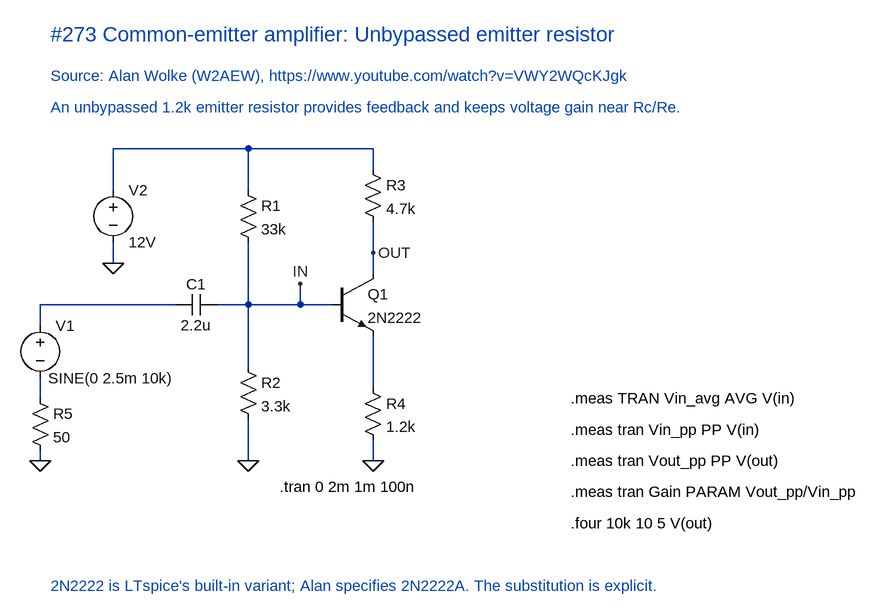
[diagram p0: schematic Unbypassed emitter resistor.asc]
Unbypassed emitter resistor.asc, the LTspice schematic file:
Version 4.1
SHEET 1 1188 680
WIRE 160 -128 -48 -128
WIRE 352 -128 160 -128
WIRE 352 -96 352 -128
WIRE -48 -64 -48 -128
WIRE 160 -64 160 -128
WIRE 352 32 352 -16
WIRE -48 48 -48 16
WIRE 352 64 352 32
WIRE 48 112 -160 112
WIRE 160 112 160 16
WIRE 160 112 112 112
WIRE 240 112 240 80
WIRE 240 112 160 112
WIRE 288 112 240 112
WIRE -160 144 -160 112
WIRE 160 208 160 112
WIRE 352 208 352 160
WIRE 352 240 352 208
WIRE -160 256 -160 224
WIRE -160 352 -160 336
WIRE 160 352 160 288
WIRE 352 352 352 320
FLAG 160 352 0
FLAG 352 352 0
FLAG -48 48 0
FLAG 352 32 OUT
FLAG -160 352 0
FLAG 240 80 IN
SYMBOL cap 112 96 R90
WINDOW 0 0 32 VBottom 2
WINDOW 3 32 32 VTop 2
SYMATTR InstName C1
SYMATTR Value 2.2u
SYMBOL res 144 -80 R0
SYMATTR InstName R1
SYMATTR Value 33k
SYMBOL res 144 192 R0
SYMATTR InstName R2
SYMATTR Value 3.3k
SYMBOL npn 288 64 R0
SYMATTR InstName Q1
SYMATTR Value 2N2222
SYMBOL res 336 -112 R0
SYMATTR InstName R3
SYMATTR Value 4.7k
SYMBOL res 336 224 R0
SYMATTR InstName R4
SYMATTR Value 1.2k
SYMBOL voltage -48 -80 R0
WINDOW 123 0 0 Left 0
WINDOW 39 0 0 Left 0
SYMATTR InstName V2
SYMATTR Value 12V
SYMBOL voltage -160 128 R0
WINDOW 3 12 97 Left 2
WINDOW 123 0 0 Left 0
WINDOW 39 0 0 Left 0
SYMATTR Value SINE(0 2.5m 10k)
SYMATTR InstName V1
SYMBOL res -176 240 R0
SYMATTR InstName R5
SYMATTR Value 50
TEXT 208 392 Left 2 !.tran 0 2m 1m 100n
TEXT 656 256 Left 2 !.meas TRAN Vin_avg AVG V(in)
TEXT 656 304 Left 2 !.meas tran Vin_pp PP V(in)
TEXT 656 352 Left 2 !.meas tran Vout_pp PP V(out)
TEXT 656 400 Left 2 !.meas tran Gain PARAM Vout_pp/Vin_pp
TEXT 656 448 Left 2 !.four 10k 10 5 V(out)
TEXT -144 -304 Left 3 ;#273 Common-emitter amplifier: Unbypassed emitter resistor
TEXT -144 -240 Left 2 ;Source: Alan Wolke (W2AEW), https://www.youtube.com/watch?v=VWY2WQcKJgk
TEXT -144 -192 Left 2 ;An unbypassed 1.2k emitter resistor provides feedback and keeps voltage gain near Rc/Re.
TEXT -144 544 Left 2 ;2N2222 is LTspice's built-in variant; Alan specifies 2N2222A. The substitution is explicit.

The netlist it stands for:
* Unbypassed emitter resistor.asc
C1 IN N002 2.2u
R1 N001 IN 33k
R2 IN 0 3.3k
Q1 OUT IN N003 0 2N2222
R3 N001 OUT 4.7k
R4 N003 0 1.2k
V2 N001 0 12V
V1 N002 N004 SINE(0 2.5m 10k)
R5 N004 0 50
.model NPN NPN
.model PNP PNP
.lib standard.bjt
.tran 0 2m 1m 100n
.meas TRAN Vin_avg AVG V(in)
.meas tran Vin_pp PP V(in)
.meas tran Vout_pp PP V(out)
.meas tran Gain PARAM Vout_pp/Vin_pp
.four 10k 10 5 V(out)
* #273 Common-emitter amplifier: Unbypassed emitter resistor
* Source: Alan Wolke (W2AEW), https://www.youtube.com/watch?v=VWY2WQcKJgk
* An unbypassed 1.2k emitter resistor provides feedback and keeps voltage gain near Rc/Re.
* 2N2222 is LTspice's built-in variant; Alan specifies 2N2222A. The substitution is explicit.
.backanno
.end